# Altium schematic sheet signal-light-18.SchDoc
size A4; SheetNumber: 21; SheetTotal: 21
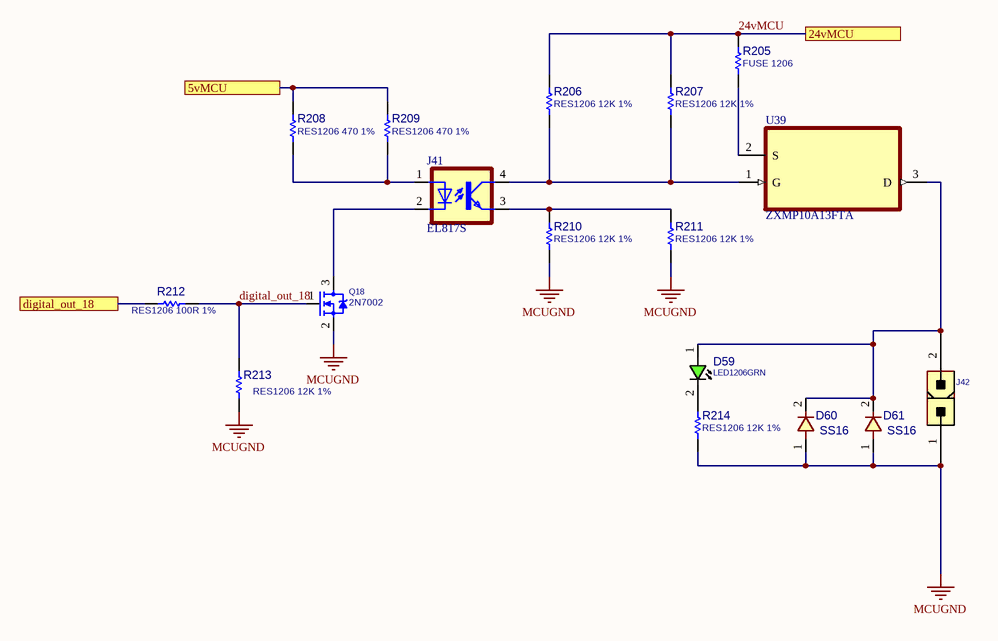
[diagram p0: signal-light-18.SchDoc]

## Parts
D59  LED1206GRN  [LED1206GRN]
D60  SS16  [D_SMA]
D61  SS16  [D_SMA]
J41  EL817S  [SOIC254P1030X460-4N]
J42  CONN_ATXPWR_2  [ATXPWR_2]  (value not drawn)
Q18  2N7002  [SOT23_3]
R205  FUSE 1206  [R1206]
R206  RES1206 12K 1%  [R1206]
R207  RES1206 12K 1%  [R1206]
R208  RES1206 470 1%  [R1206]
R209  RES1206 470 1%  [R1206]
R210  RES1206 12K 1%  [R1206]
R211  RES1206 12K 1%  [R1206]
R212  RES1206 100R 1%  [R1206]
R213  RES1206 12K 1%  [R1206]
R214  RES1206 12K 1%  [R1206]
U39  ZXMP10A13FTA  [SOT95P230X110-3N]

## Ports
5vMCU, 24vMCU, digital_out_18

## Nets
MCUGND: D60.1 D61.1 J42.1 Q18.2(SOURCE) R210.2 R211.2 R213.2 R214.2
5vMCU: R208.2 R209.2 ; port 5vMCU
24vMCU: R205.1 R206.1 R207.1 ; port 24vMCU
digital_out_18: Q18.1(GATE) R212.2 R213.1
digital_out_18: R212.1 ; port digital_out_18  [a separate net that carries the same name]
NetD59_1: D59.1(ANODE) D60.2 D61.2 J42.2 U39.3(D)
NetD59_2: D59.2(CATHODE) R214.1
NetJ41_1: J41.1(A) R208.1 R209.1
NetJ41_2: J41.2(C) Q18.3(DRAIN)
NetJ41_3: J41.3(EMIT) R210.1 R211.1
NetJ41_4: J41.4(COL) R206.2 R207.2 U39.1(G)
NetR205_2: R205.2 U39.2(S)

## Library data of the parts
D59 = LED_SMD_1206_GRN: LED, SMD, 1206, GREEN; PARAM: 20mA; DESC: DESCRIPTION; PARAM2: 2.2V; MANF: -; ASSEMBLY: ASSEMBLY; PRICE: 36t@Javan; MANF_P#: -; VALUE: LED1206GRN; MountType: SMT; PartType: LED
D60 D61 = DIODE_SMD_1N4001: DIODE, GENERAL PURPOSE, 50V/1A; DESC: DESCRIPTION; PARAM: 50V VRRM; PARAM2: 1A; MANF_P#: 1N4001; MANF: MANF; ASSEMBLY: ASSEMBLY; PRICE: PRICE; VALUE: SS16
J41 = EL817S: Optoisolator Transistor Output 5000Vrms 1 Channel 4-SMD; MF: Everlight Electronics; SnapEDA_Link: https://www.snapeda.com/parts/EL817S/Everlight+Electronics+Co+Ltd/view-part/?ref=snap; Package: SMD-4 Everlight Electronics Co Ltd; Value: *; MP: EL817S; Check_prices: https://www.snapeda.com/parts/EL817S/Everlight+Electronics+Co+Ltd/view-part/?ref=eda
J42 = CONN_ATXPWR_2: CONN, ATX POWER, 2 P; MANF: Molex; MANF_P#: 39281023; VALUE: CONN_ATXPWR_2; MountType: THD; PACKAGE: ATXPWR-2pin; Part Type: Conn.
Q18 = MOSN_2N7002_SOT23: MOSFET, N-CH, 60V, 0.3A; MANF: NXP; ASSEMBLY: ASSEMBLY; MANF_P#: 2N7002; PARAM2: 60v; PARAM: 0.3A; PRICE: 0.3t@Javan; VALUE: 2N7002
R205-R214 = RES_SMD_1206: RESISTOR, SMD; PARAM: 1%, 0.25W; DESC: DESCRIPTION; DIST#: MOUSER; MANF_P#: -; MANF: -; ASSEMBLY: ASSEMBLY; PRICE: -; PARAM2: -
U39 = ZXMP10A13FTA: P-Channel 100 V 600mA (Ta) 625mW (Ta) Surface Mount SOT-23-3; MF: Diodes Inc.; Purchase-URL: https://pricing.snapeda.com/search/part/ZXMP10A13FTA/?ref=eda; Package: SOT-23-3 Diodes Inc.; SnapEDA_Link: https://www.snapeda.com/parts/ZXMP10A13FTA/Diodes+Inc./view-part/?ref=snap; Availability: In Stock; Value: *; MP: ZXMP10A13FTA; Check_prices: https://www.snapeda.com/parts/ZXMP10A13FTA/Diodes+Inc./view-part/?ref=eda; Price: None